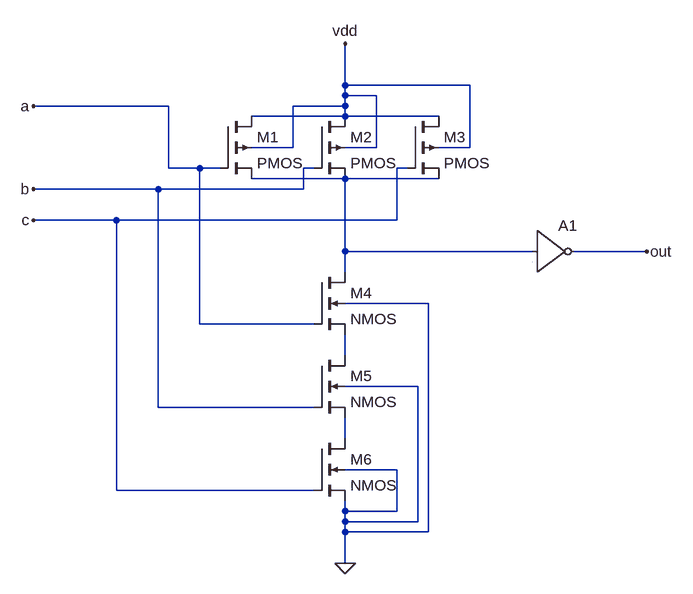
[diagram p0: schematic cmos_3input_and_gate.asc]
cmos_3input_and_gate.asc, the LTspice schematic file:
Version 4
SHEET 1 880 788
WIRE 288 32 288 -32
WIRE 480 32 288 32
WIRE 288 48 288 32
WIRE 336 48 288 48
WIRE 16 64 -192 64
WIRE 288 64 288 48
WIRE 288 64 208 64
WIRE 288 80 288 64
WIRE 288 80 144 80
WIRE 432 80 288 80
WIRE 208 128 208 64
WIRE 208 128 144 128
WIRE 336 128 336 48
WIRE 336 128 288 128
WIRE 480 128 480 32
WIRE 480 128 432 128
WIRE 16 160 16 64
WIRE 64 160 16 160
WIRE 96 160 64 160
WIRE 240 160 224 160
WIRE 384 160 368 160
WIRE 288 176 144 176
WIRE 432 176 288 176
WIRE 0 192 -192 192
WIRE 224 192 224 160
WIRE 224 192 0 192
WIRE -64 240 -192 240
WIRE 368 240 368 160
WIRE 368 240 -64 240
WIRE 288 288 288 176
WIRE 576 288 288 288
WIRE 752 288 640 288
WIRE 288 320 288 288
WIRE 416 368 288 368
WIRE 64 400 64 160
WIRE 240 400 64 400
WIRE 288 448 288 416
WIRE 400 496 288 496
WIRE 0 528 0 192
WIRE 240 528 0 528
WIRE 288 576 288 544
WIRE 368 624 288 624
WIRE -64 656 -64 240
WIRE 240 656 -64 656
WIRE 288 688 288 672
WIRE 368 688 368 624
WIRE 368 688 288 688
WIRE 288 704 288 688
WIRE 400 704 400 496
WIRE 400 704 288 704
WIRE 288 720 288 704
WIRE 416 720 416 368
WIRE 416 720 288 720
WIRE 288 768 288 720
FLAG 288 768 0
FLAG 752 288 out
FLAG 288 -32 vdd
FLAG -192 64 a
FLAG -192 192 b
FLAG -192 240 c
SYMBOL pmos4 96 80 R0
SYMATTR InstName M1
SYMBOL pmos4 240 80 R0
SYMATTR InstName M2
SYMBOL pmos4 384 80 R0
SYMATTR InstName M3
SYMBOL nmos4 240 320 R0
SYMATTR InstName M4
SYMBOL nmos4 240 448 R0
SYMATTR InstName M5
SYMBOL nmos4 240 576 R0
SYMATTR InstName M6
SYMBOL Digital\\inv 576 224 R0
SYMATTR InstName A1

The netlist it stands for:
* cmos_3input_and_gate.asc
M1 vdd a N001 vdd PMOS
M2 vdd b N001 vdd PMOS
M3 vdd c N001 vdd PMOS
M4 N001 a N002 0 NMOS
M5 N002 b N003 0 NMOS
M6 N003 c 0 0 NMOS
A1 N001 0 0 0 0 out 0 0 BUF
.model NMOS NMOS
.model PMOS PMOS
.lib standard.mos
.backanno
.end